# EasyEDA Pro project 尾部RGB灯板.epro

# Schematic Schematic1
Board Name: Board1; Create Date: 2025-04-24; Page Name: P1; Project Name: WS2812B灯带; Schematic Name: Schematic1; Update Date: 2025-04-24; BladeWidth: 10; Company: 嘉立创EDA; Page Size: A4; RegionStart: 1; ShowBorder: 1; TitleBlock: 1; TitleBlockPosition: 3; Version: V1.0; XRegionCount: 6; YRegionCount: 4
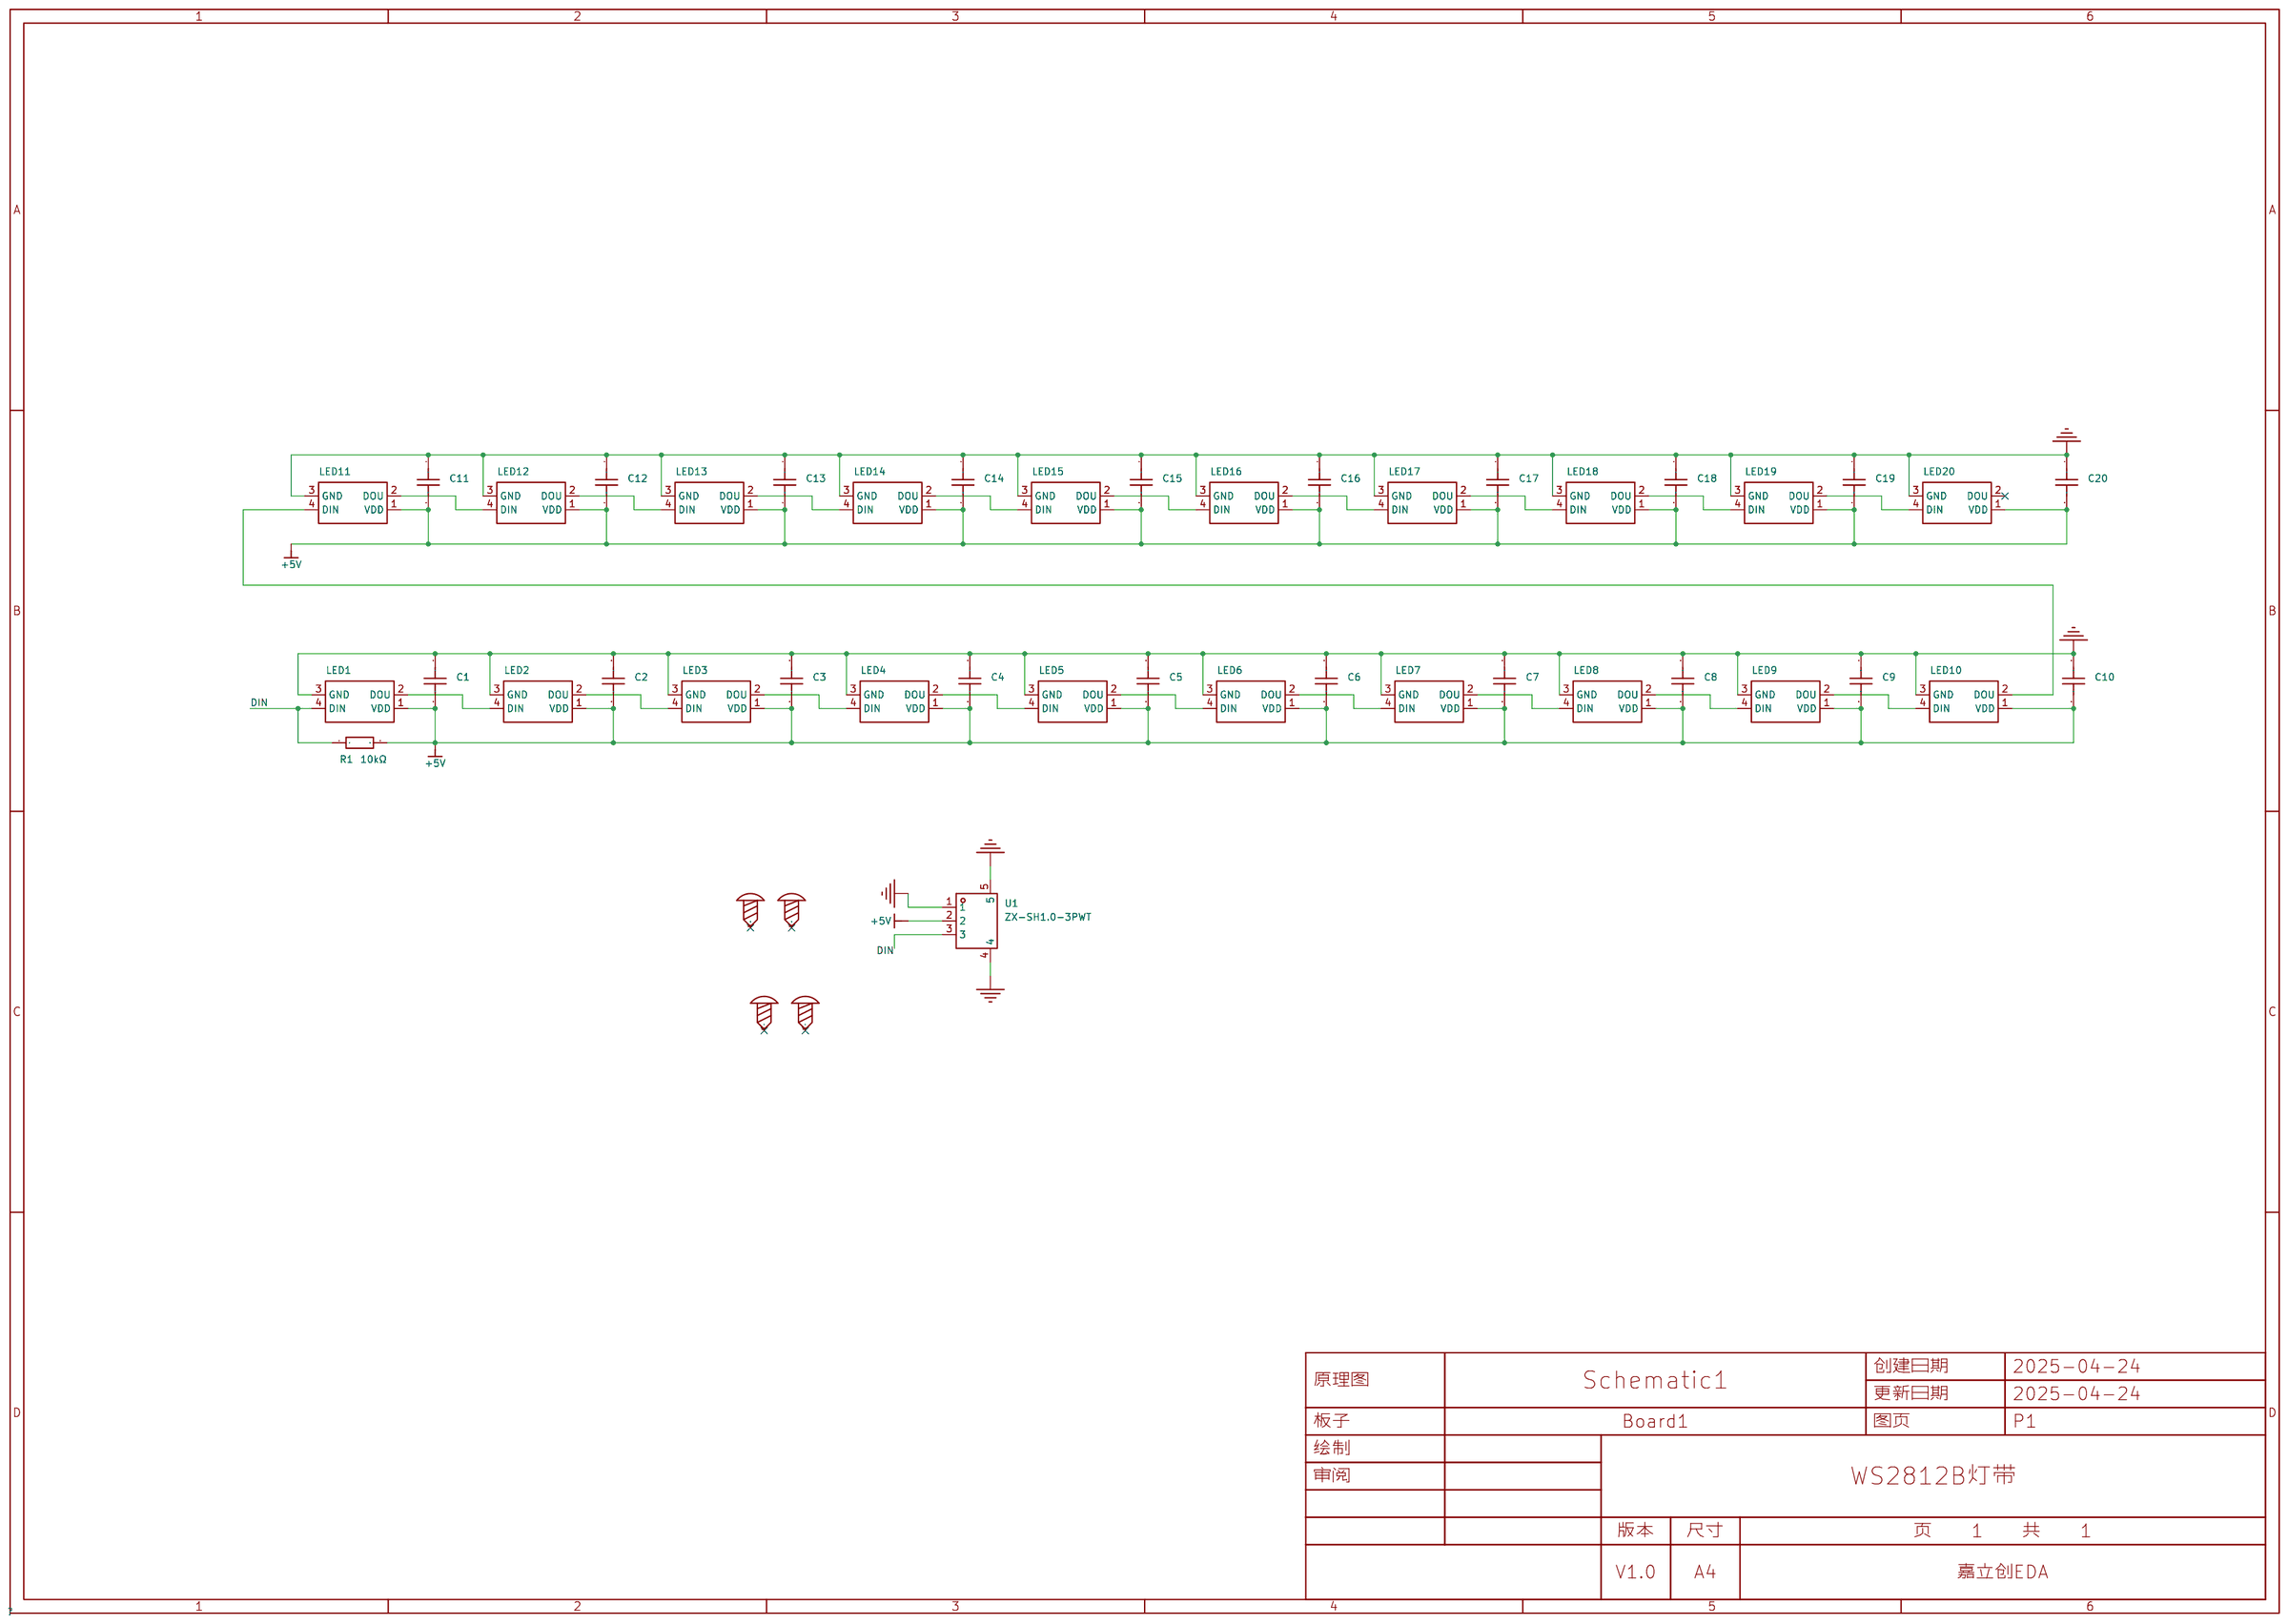
[diagram p0: schematic sheet]

## Parts
C1  100nF  [C0805]
C2  100nF  [C0805]
C3  100nF  [C0805]
C4  100nF  [C0805]
C5  100nF  [C0805]
C6  100nF  [C0805]
C7  100nF  [C0805]
C8  100nF  [C0805]
C9  100nF  [C0805]
C10  100nF  [C0805]
C11  100nF  [C0805]
C12  100nF  [C0805]
C13  100nF  [C0805]
C14  100nF  [C0805]
C15  100nF  [C0805]
C16  100nF  [C0805]
C17  100nF  [C0805]
C18  100nF  [C0805]
C19  100nF  [C0805]
C20  100nF  [C0805]
LED1  XL-5050RGBC-WS2812B  [LED-SMD_4P-L5.0-W5.0-BL_XL-5050RGBC]
LED2  XL-5050RGBC-WS2812B  [LED-SMD_4P-L5.0-W5.0-BL_XL-5050RGBC]
LED3  XL-5050RGBC-WS2812B  [LED-SMD_4P-L5.0-W5.0-BL_XL-5050RGBC]
LED4  XL-5050RGBC-WS2812B  [LED-SMD_4P-L5.0-W5.0-BL_XL-5050RGBC]
LED5  XL-5050RGBC-WS2812B  [LED-SMD_4P-L5.0-W5.0-BL_XL-5050RGBC]
LED6  XL-5050RGBC-WS2812B  [LED-SMD_4P-L5.0-W5.0-BL_XL-5050RGBC]
LED7  XL-5050RGBC-WS2812B  [LED-SMD_4P-L5.0-W5.0-BL_XL-5050RGBC]
LED8  XL-5050RGBC-WS2812B  [LED-SMD_4P-L5.0-W5.0-BL_XL-5050RGBC]
LED9  XL-5050RGBC-WS2812B  [LED-SMD_4P-L5.0-W5.0-BL_XL-5050RGBC]
LED10  XL-5050RGBC-WS2812B  [LED-SMD_4P-L5.0-W5.0-BL_XL-5050RGBC]
LED11  XL-5050RGBC-WS2812B  [LED-SMD_4P-L5.0-W5.0-BL_XL-5050RGBC]
LED12  XL-5050RGBC-WS2812B  [LED-SMD_4P-L5.0-W5.0-BL_XL-5050RGBC]
LED13  XL-5050RGBC-WS2812B  [LED-SMD_4P-L5.0-W5.0-BL_XL-5050RGBC]
LED14  XL-5050RGBC-WS2812B  [LED-SMD_4P-L5.0-W5.0-BL_XL-5050RGBC]
LED15  XL-5050RGBC-WS2812B  [LED-SMD_4P-L5.0-W5.0-BL_XL-5050RGBC]
LED16  XL-5050RGBC-WS2812B  [LED-SMD_4P-L5.0-W5.0-BL_XL-5050RGBC]
LED17  XL-5050RGBC-WS2812B  [LED-SMD_4P-L5.0-W5.0-BL_XL-5050RGBC]
LED18  XL-5050RGBC-WS2812B  [LED-SMD_4P-L5.0-W5.0-BL_XL-5050RGBC]
LED19  XL-5050RGBC-WS2812B  [LED-SMD_4P-L5.0-W5.0-BL_XL-5050RGBC]
LED20  XL-5050RGBC-WS2812B  [LED-SMD_4P-L5.0-W5.0-BL_XL-5050RGBC]
R1  10kΩ  [R0805]
SCREW1  -  [M3螺丝]
SCREW2  -  [M3螺丝]
SCREW3  -  [M3螺丝]
SCREW4  -  [M3螺丝]
U1  ZX-SH1.0-3PWT  [CONN-SMD_3P-P1.00_MEGASTAR_ZX-SH1.0-3PWT]

## Library data of the parts
C1-C20 = CC0805KRX7R9BB104: 容值:100nF;精度:±10%;额定电压:50V;材质(温度系数):X7R;; LCSC Part Name: 100nF ±10% 50V; Supplier Part: C49678; Manufacturer: YAGEO(国巨); Supplier Footprint: 0805; JLCPCB Part Class: 基础库; Datasheet: https://atta.szlcsc.com/upload/public/pdf/source/20180224/C181747_15194369449651363981.pdf; Supplier: LCSC; Tolerance: ±10%; Voltage Rated: 50V; Temperature Coefficient: X7R
LED1-LED20 = XL-5050RGBC-WS2812B: 5050七彩幻彩透明贴片LED灯珠 5050 幻彩透明四脚 ws2812B 内置驱动IC; Supplier Part: C2843785; Manufacturer: XINGLIGHT(成兴光); Supplier Footprint: SMD5050; JLCPCB Part Class: 扩展库; Datasheet: https://atta.szlcsc.com/upload/public/pdf/source/20240412/E1004CAA80592E31D08BFE019083806F.pdf; Supplier: LCSC
R1 = 0805W8F1002T5E_C17414: 电阻类型:厚膜电阻;阻值:10kΩ;精度:±1%;功率:125mW;最大工作电压:150V;温度系数:±100ppm/℃;; LCSC Part Name: 10kΩ ±1% 125mW 厚膜电阻; Supplier Part: C17414; Manufacturer: UNI-ROYAL(厚声); Manufacturer Part: 0805W8F1002T5E; Supplier Footprint: 0805; JLCPCB Part Class: 基础库; Datasheet: https://atta.szlcsc.com/upload/public/pdf/source/20200306/C422600_1E6D84923E4A46A82E41ADD87F860B5C.pdf; Supplier: LCSC; Type: 厚膜电阻; Tolerance: ±1%; Power(Watts): 125mW; Overload Voltage (Max): 150V; Temperature Coefficient: ±100ppm/℃; Operating Temperature Range: -55℃~+155℃
SCREW1-SCREW4 = M3螺丝: Supplier Footprint: 插件
U1 = ZX-SH1.0-3PWT: 插针结构:1x3P;间距:1mm;安装方式:卧贴;参考系列:SH;总PIN数:3P;排数:1;每排PIN数:3;行距:-;额定电流:1A;触头材质:黄铜;触头镀层:锡;工作温度:-40℃~+85℃;; LCSC Part Name: 1x3P 间距:1mm 卧贴 系列:SH; Supplier Part: C7430445; Manufacturer: Megastar(兆星); Supplier Footprint: SMD,P=1mm,卧贴; JLCPCB Part Class: Extended Part; Datasheet: https://item.szlcsc.com/datasheet/ZX-SH1.0-3PWT/8430314.html; Supplier: LCSC; Pins Structure: 1x3P; Pitch: 1mm; Mounting Type: 卧贴; Reference Series: SH; Number of Pins: 3P; Number of Rows: 1; Number of PINs Per Row: 3; Current Rating: 1A; Contact Material: 黄铜; Contact Plating: 锡; Operating Temperature: -40℃~+85℃; Voltage Rating: 50V; Plastic Material: LCP; Supplementary Features: 辅助焊脚; Color: 米色; Z-Height of the Board: 3.15mm; X-Length of Bottom Edge on Board (Spacing Line): 5.35mm; Y-Width of Bottom Edge on Board: 4.3mm

## Nets
+5V: C1.2 C2.2 C3.2 C4.2 C5.2 C6.2 C7.2 C8.2 C9.2 C10.2 C11.2 C12.2 C13.2 C14.2 C15.2 C16.2 C17.2 C18.2 C19.2 C20.2 LED1.1(VDD) LED2.1(VDD) LED3.1(VDD) LED4.1(VDD) LED5.1(VDD) LED6.1(VDD) LED7.1(VDD) LED8.1(VDD) LED9.1(VDD) LED10.1(VDD) LED11.1(VDD) LED12.1(VDD) LED13.1(VDD) LED14.1(VDD) LED15.1(VDD) LED16.1(VDD) LED17.1(VDD) LED18.1(VDD) LED19.1(VDD) LED20.1(VDD) R1.2 U1.2
GND: C1.1 C2.1 C3.1 C4.1 C5.1 C6.1 C7.1 C8.1 C9.1 C10.1 C11.1 C12.1 C13.1 C14.1 C15.1 C16.1 C17.1 C18.1 C19.1 C20.1 LED1.3(GND) LED2.3(GND) LED3.3(GND) LED4.3(GND) LED5.3(GND) LED6.3(GND) LED7.3(GND) LED8.3(GND) LED9.3(GND) LED10.3(GND) LED11.3(GND) LED12.3(GND) LED13.3(GND) LED14.3(GND) LED15.3(GND) LED16.3(GND) LED17.3(GND) LED18.3(GND) LED19.3(GND) LED20.3(GND) U1.1 U1.4 U1.5
DIN: LED1.4(DIN) R1.1 U1.3
$1N1120: LED9.2(DOU) LED10.4(DIN)
$1N1128: LED8.2(DOU) LED9.4(DIN)
$1N1132: LED7.2(DOU) LED8.4(DIN)
$1N1136: LED6.2(DOU) LED7.4(DIN)
$1N1142: LED5.2(DOU) LED6.4(DIN)
$1N1146: LED4.2(DOU) LED5.4(DIN)
$1N1150: LED3.2(DOU) LED4.4(DIN)
$1N1154: LED2.2(DOU) LED3.4(DIN)
$1N1158: LED1.2(DOU) LED2.4(DIN)
$1N3672: LED10.2(DOU) LED11.4(DIN)
$1N3842: LED11.2(DOU) LED12.4(DIN)
$1N3843: LED12.2(DOU) LED13.4(DIN)
$1N3844: LED13.2(DOU) LED14.4(DIN)
$1N3845: LED14.2(DOU) LED15.4(DIN)
$1N3846: LED15.2(DOU) LED16.4(DIN)
$1N3847: LED16.2(DOU) LED17.4(DIN)
$1N3848: LED17.2(DOU) LED18.4(DIN)
$1N3849: LED18.2(DOU) LED19.4(DIN)
$1N3850: LED19.2(DOU) LED20.4(DIN)

Not connected (* = marked no-connect by the designer): LED20 2(DOU)*; SCREW1 1*; SCREW2 1*; SCREW3 1*; SCREW4 1*

# Board PCB1
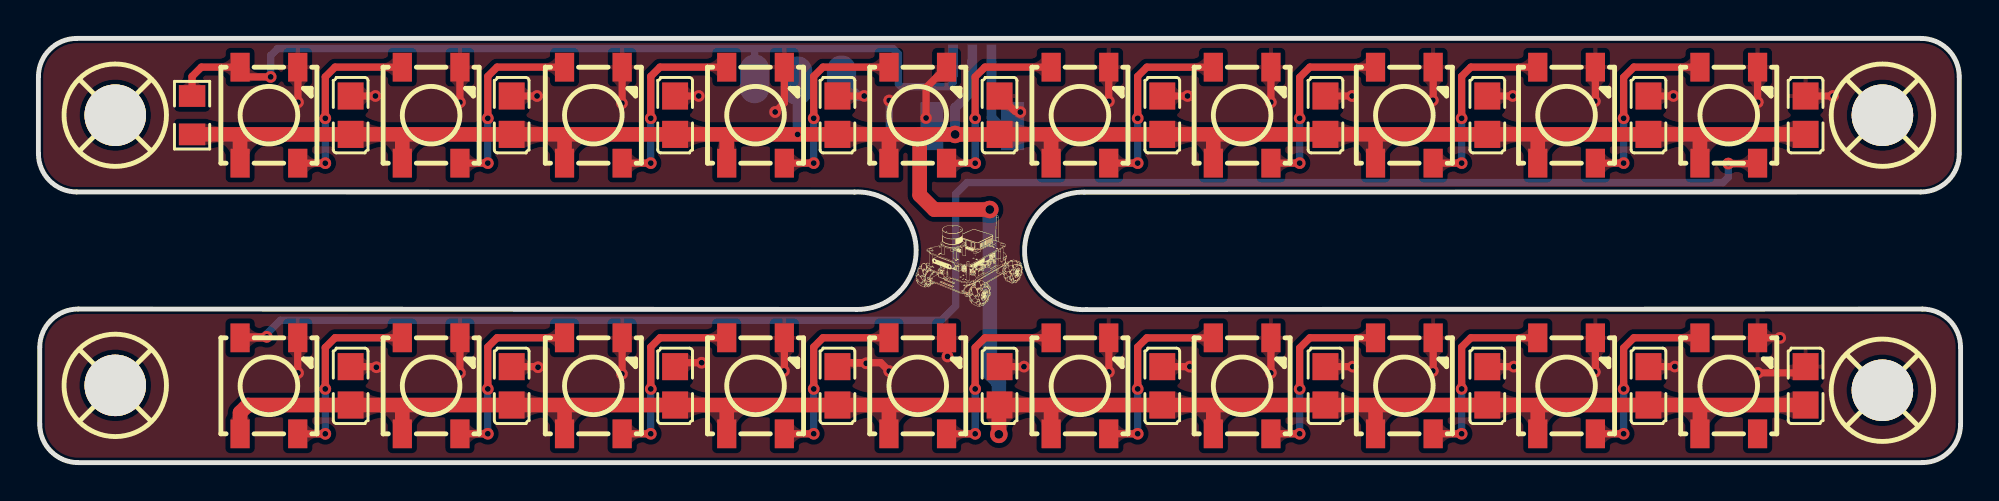
[diagram p1: board, top side]
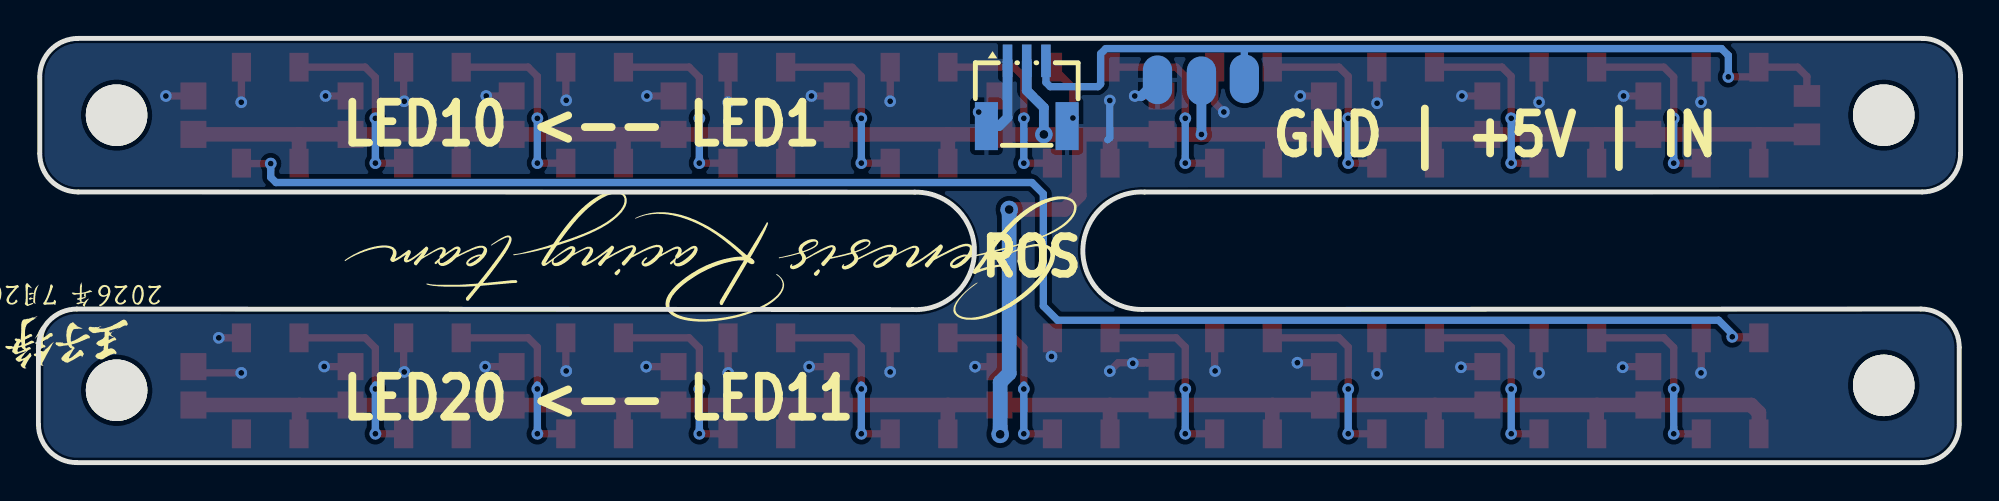
[diagram p2: board, bottom side, seen from below]

Outline 100.07 x 22.1 mm; copper layers: Top Layer, Bottom Layer. Coordinates in mm from the lower left corner of the outline.
Outline path: 0,20.1 arc(0.59,21.51) 2,22.1 98,22.1 arc(99.41,21.51) 100,20.1 100,16.1 arc(99.41,14.68) 98,14.1 54.45,14.09 arc(51.34,10.98) 54.55,7.97 98.07,8 arc(99.48,7.41) 100.07,6 100.07,2 arc(99.48,0.59) 98.07,0 2.07,0 arc(0.65,0.59) 0.07,2 0.07,6 arc(0.65,7.41) 2.07,8 42.59,7.98 arc(45.7,11.09) 42.48,14.09 2,14.1 arc(0.59,14.68) 0,16.1 0,20.1
Stack: Top Layer 0.035mm / Dielectric1 1.51mm FR4 er 4.5 / Bottom Layer 0.035mm

## Design rules (mm)
spacing copperThickness1oz (default): track to track 0.102, other pairs 0.152 to 0.3
spacing copperThickness2oz: track to track 0.203, other pairs 0.152 to 0.3
spacing Plane_innerPlane: track to track 0.102, other pairs 0.152 to 0.3
spacing Copper_copperRegion: track to track 0.102, other pairs 0.152 to 0.3
track width copperThickness1oz (default): min 0.127, default 0.254, max 2.54
track width copperThickness2oz: min 0.203, default 0.254, max 2.54
differential pair differentialPair (default): width min 0.127, default 0.254, max 2.54; gap min 0.152, default 0.152
net GND uses copperRegion_copperThickness1oz
pour e126 uses Copper_copperRegion, copperRegion_Copper_copperRegion
pour e181 uses Copper_copperRegion, copperRegion_Copper_copperRegion
pour e642 uses Copper_copperRegion, copperRegion_Copper_copperRegion
pour e657 uses Copper_copperRegion, copperRegion_Copper_copperRegion

## Placement (name value [footprint] x y rotation side)
C1  100nF  [C0805]  16.25 18.1 270 top
C2  100nF  [C0805]  24.64 18.1 270 top
C3  100nF  [C0805]  33.15 18.1 270 top
C4  100nF  [C0805]  41.6 18.1 270 top
C5  100nF  [C0805]  50.04 18.1 270 top
C6  100nF  [C0805]  58.51 18.1 270 top
C7  100nF  [C0805]  67 18.1 270 top
C8  100nF  [C0805]  75.43 18.1 270 top
C9  100nF  [C0805]  83.82 18.1 270 top
C10  100nF  [C0805]  92 18.1 270 top
C11  100nF  [C0805]  58.51 4 270 top
C12  100nF  [C0805]  50.04 4 270 top
C13  100nF  [C0805]  41.6 4 270 top
C14  100nF  [C0805]  33.15 4 270 top
C15  100nF  [C0805]  24.64 4 270 top
C16  100nF  [C0805]  16.25 4 270 top
C17  100nF  [C0805]  83.82 4 270 top
C18  100nF  [C0805]  75.43 4 270 top
C19  100nF  [C0805]  67 4 270 top
C20  100nF  [C0805]  92 4 270 top
LED1  XL-5050RGBC-WS2812B  [LED-SMD_4P-L5.0-W5.0-BL_XL-5050RGBC]  12 18.1 0 top
LED2  XL-5050RGBC-WS2812B  [LED-SMD_4P-L5.0-W5.0-BL_XL-5050RGBC]  20.44 18.1 0 top
LED3  XL-5050RGBC-WS2812B  [LED-SMD_4P-L5.0-W5.0-BL_XL-5050RGBC]  28.89 18.1 0 top
LED4  XL-5050RGBC-WS2812B  [LED-SMD_4P-L5.0-W5.0-BL_XL-5050RGBC]  37.33 18.1 0 top
LED5  XL-5050RGBC-WS2812B  [LED-SMD_4P-L5.0-W5.0-BL_XL-5050RGBC]  45.78 18.1 0 top
LED6  XL-5050RGBC-WS2812B  [LED-SMD_4P-L5.0-W5.0-BL_XL-5050RGBC]  54.22 18.1 0 top
LED7  XL-5050RGBC-WS2812B  [LED-SMD_4P-L5.0-W5.0-BL_XL-5050RGBC]  62.67 18.1 0 top
LED8  XL-5050RGBC-WS2812B  [LED-SMD_4P-L5.0-W5.0-BL_XL-5050RGBC]  71.11 18.1 0 top
LED9  XL-5050RGBC-WS2812B  [LED-SMD_4P-L5.0-W5.0-BL_XL-5050RGBC]  79.56 18.1 0 top
LED10  XL-5050RGBC-WS2812B  [LED-SMD_4P-L5.0-W5.0-BL_XL-5050RGBC]  88 18.1 0 top
LED11  XL-5050RGBC-WS2812B  [LED-SMD_4P-L5.0-W5.0-BL_XL-5050RGBC]  12 4 0 top
LED12  XL-5050RGBC-WS2812B  [LED-SMD_4P-L5.0-W5.0-BL_XL-5050RGBC]  20.44 4 0 top
LED13  XL-5050RGBC-WS2812B  [LED-SMD_4P-L5.0-W5.0-BL_XL-5050RGBC]  28.89 4 0 top
LED14  XL-5050RGBC-WS2812B  [LED-SMD_4P-L5.0-W5.0-BL_XL-5050RGBC]  37.33 4 0 top
LED15  XL-5050RGBC-WS2812B  [LED-SMD_4P-L5.0-W5.0-BL_XL-5050RGBC]  45.78 4 0 top
LED16  XL-5050RGBC-WS2812B  [LED-SMD_4P-L5.0-W5.0-BL_XL-5050RGBC]  54.22 4 0 top
LED17  XL-5050RGBC-WS2812B  [LED-SMD_4P-L5.0-W5.0-BL_XL-5050RGBC]  62.67 4 0 top
LED18  XL-5050RGBC-WS2812B  [LED-SMD_4P-L5.0-W5.0-BL_XL-5050RGBC]  71.11 4 0 top
LED19  XL-5050RGBC-WS2812B  [LED-SMD_4P-L5.0-W5.0-BL_XL-5050RGBC]  79.56 4 0 top
LED20  XL-5050RGBC-WS2812B  [LED-SMD_4P-L5.0-W5.0-BL_XL-5050RGBC]  88 4 0 top
NOREF  -  [Pad_e808]  39.52 19.89 0 top
NOREF#2  -  [Pad_e807]  37.29 19.99 0 top
NOREF#3  -  [Pad_e809]  41.81 19.94 0 top
R1  10kΩ  [R0805]  8 18.1 270 top
SCREW1  -  [M3螺丝]  96 18.1 0 top
SCREW2  -  [M3螺丝]  4 18.1 0 top
SCREW3  -  [M3螺丝]  4 4.02 0 top
SCREW4  -  [M3螺丝]  96 3.77 0 top
U1  ZX-SH1.0-3PWT  [CONN-SMD_3P-P1.00_MEGASTAR_ZX-SH1.0-3PWT]  48.62 19.23 180 bottom

## Footprints (pads in the part's own frame, mm; a bottom-side part is the same pattern mirrored in y, then rotated)
C0805
  rect 1.41x1.35 smd: 1(-1,0) 2(1,0)
CONN-SMD_3P-P1.00_MEGASTAR_ZX-SH1.0-3PWT
  rect 0.5x1.7 smd: 1(-1,1.7) 2(0,1.7) 3(1,1.7)
  rect 1.2x2.5 smd: 4(-2.1,-1.7) 5(2.1,-1.7)
LED-SMD_4P-L5.0-W5.0-BL_XL-5050RGBC
  rect 1x1.5 smd: 1(-1.5,-2.5) 2(1.5,-2.5) 3(1.5,2.5) 4(-1.5,2.5)
M3螺丝
  round 3.2 hole 3.2: 1(0,0)
Pad_e807
  oval 1.524x2.54 smd far side: 1(0,0)
Pad_e808
  oval 1.524x2.54 smd far side: 2(0,0)
Pad_e809
  oval 1.524x2.54 smd far side: 3(0,0)
R0805
  rect 1.133x1.377 smd: 1(-1,0) 2(1,0)

## Nets
As in the schematic, except:
+5V: C1.2 C2.2 C3.2 C4.2 C5.2 C6.2 C7.2 C8.2 C9.2 C10.2 C11.2 C12.2 C13.2 C14.2 C15.2 C16.2 C17.2 C18.2 C19.2 C20.2 LED1.1 LED2.1 LED3.1 LED4.1 LED5.1 LED6.1 LED7.1 LED8.1 LED9.1 LED10.1 LED11.1 LED12.1 LED13.1 LED14.1 LED15.1 LED16.1 LED17.1 LED18.1 LED19.1 LED20.1 NOREF.2 R1.2 U1.2
GND: C1.1 C2.1 C3.1 C4.1 C5.1 C6.1 C7.1 C8.1 C9.1 C10.1 C11.1 C12.1 C13.1 C14.1 C15.1 C16.1 C17.1 C18.1 C19.1 C20.1 LED1.3 LED2.3 LED3.3 LED4.3 LED5.3 LED6.3 LED7.3 LED8.3 LED9.3 LED10.3 LED11.3 LED12.3 LED13.3 LED14.3 LED15.3 LED16.3 LED17.3 LED18.3 LED19.3 LED20.3 NOREF#3.3 U1.1 U1.4 U1.5
DIN: LED1.4 NOREF#2.1 R1.1 U1.3

Pads without a net: LED20 2; SCREW1 1; SCREW2 1; SCREW3 1; SCREW4 1

## Via types
v1: diameter 0.61, hole 0.305, Top Layer to Bottom Layer, 82 vias
v2: diameter 0.914, hole 0.457, Top Layer to Bottom Layer, 3 vias

## Routing (per net, layer and track width the routed paths; a pad name or vN(x,y) marks a point on that pad's centre or on a via; arc(x,y) is an arc through that point)
+5V: length 222.9
  Top Layer w0.762: 69.58,17.1 69.61,17.07 LED8.1 ; 69.58,17.1 C7.2 61.19,17.1 ; 69.58,17.1 C8.2 78.04,17.1 ; 52.71,17.1 C6.2 61.19,17.1 ; 52.71,17.1 52.72,17.09 LED6.1 ; 52.71,17.1 C5.2 50.03,17.09 v2(47.72,17.09) 45.88,17.09 45.88,17.1 ; 86.48,3 C17.2 78.04,3 ; 86.48,3 86.5,2.98 LED20.1 ; 86.48,3 C20.2 ; 86.48,17.1 C10.2 ; 86.48,17.1 C9.2 78.04,17.1 ; 86.48,17.1 86.5,17.08 LED10.1 ; LED15.1 44.28,2.99 44.28,3 ; 44.28,17.1 C4.2 35.82,17.1 ; 44.28,17.1 45.88,17.1 ; 44.28,17.1 44.28,17.09 LED5.1 ; LED2.1 18.94,17.08 18.93,17.1 ; 78.04,17.1 78.06,17.09 LED9.1 ; 18.93,3 C15.2 27.37,3 ; 18.93,3 C16.2 10.9,3 10.5,2.6 LED11.1 ; 18.93,3 18.94,2.99 LED12.1 ; 18.93,17.1 C1.2 10.47,17.1 ; 18.93,17.1 C2.2 27.37,17.1 ; 61.17,15.6 61.17,17.07 61.19,17.1 ; v2(49.53,13.18) 46.63,13.18 45.88,13.94 45.88,17.1 ; 27.37,3 27.39,2.98 27.39,1.5 ; 27.37,3 C14.2 35.82,3 ; 61.19,3 61.17,2.97 61.17,1.5 ; 61.19,3 C19.2 69.58,3 ; 61.19,3 C11.2 52.71,3 ; 35.82,17.1 C3.2 27.37,17.1 ; 35.82,17.1 35.83,17.08 LED4.1 ; 52.71,3 C12.2 ; 52.71,3 52.72,2.99 LED16.1 ; C12.2 44.28,3 ; C12.2 50,2.96 v2(50,1.47) ; 69.58,3 69.61,2.97 LED18.1 ; 69.58,3 C18.2 78.04,3 ; 78.04,3 78.06,2.99 LED19.1 ; LED14.1 35.83,2.98 35.82,3 ; 35.82,3 C13.2 44.28,3 ; 27.37,17.1 27.39,17.08 27.39,15.6 ; 10.47,17.1 10.5,17.07 LED1.1 ; 10.47,17.1 R1.2
  Bottom Layer w0.508: v2(47.72,17.09) 47.72,18.49 48.62,19.38 48.62,20.88 ; NOREF.2 v1(39.52,17.09)
  Bottom Layer w0.762: v2(49.53,13.18) 49.53,4.65 50,4.18 v2(50,1.47)
GND: length 76.5
  Top Layer w0.381: LED2.3 21.94,18.77 ; LED18.3 72.61,4.79 v1(72.59,4.77) ; C9.1 v1(85.12,19.1) ; v1(13.51,18.77) 13.51,20.58 LED1.3 ; 41.6,5.2 42.33,5.2 ; 42.33,5.2 v1(43.09,5.17) ; 42.33,5.2 43.85,5.2 v1(44.29,4.77) ; LED10.3 89.5,18.78 v1(89.51,18.77) ; C8.1 v1(76.75,19.1) ; v1(55.73,4.72) 55.73,6.49 LED16.3 ; 38.83,6.7 38.83,4.8 v1(38.81,4.77) ; C16.1 17.56,5 v1(17.59,4.97) ; C20.1 91.67,4.67 v1(89.51,4.67) ; v1(46.21,17.95) 46.21,19.53 LED5.3 ; v1(81.03,4.72) 81.06,4.75 LED19.3 ; LED7.3 64.17,18.78 v1(64.16,18.77) ; v1(38.35,18.26) 38.83,18.74 38.83,20.6 ; LED3.3 30.39,18.73 v1(30.38,18.72) ; C19.1 v1(68.43,5) ; C7.1 v1(68.39,19.1) ; v1(72.59,18.87) 72.61,18.89 LED8.3 ; v1(30.38,4.62) 30.39,4.63 30.39,6.7 ; v1(47.33,5.53) 47.33,6.65 47.28,6.7 ; v1(64.16,4.67) 64.17,4.68 LED17.3 ; C2.1 v1(25.96,19.1) ; 33.15,5.2 v1(34.53,5.2) ; C6.1 v1(59.82,19.1) ; C18.1 v1(76.81,5) ; C11.1 v1(59.94,5) ; v1(81.03,18.82) 81.06,18.85 LED9.3 ; C10.1 93.43,19.1 v1(93.43,19.1) ; C15.1 25.98,5 v1(26.01,4.97) ; C17.1 85.19,5 v1(85.19,5) ; v1(55.73,18.82) 55.72,18.83 LED6.3 ; 13.5,6.7 13.5,4.69 v1(13.51,4.67) ; C1.1 v1(17.54,19.1) ; LED20.3 v1(90.68,6.5) ; C5.1 50.84,18.29 ; C3.1 v1(34.37,19.1) ; C12.1 v1(51.31,5) ; C4.1 v1(42.99,19.1) ; 21.94,6.7 21.94,4.67
  Bottom Layer w0.381: v1(44.29,18.86) 44.29,16.93 44.4,16.82
  Bottom Layer w0.508: U1.1 49.62,17.97 50.06,17.53 U1.4 ; v1(46.21,17.95) 46.52,17.65 U1.5 ; v1(42.99,19.1) 42.65,19.1 NOREF#3.3
  vias: v1(21.95,18.77) v1(21.95,4.67) v1(51.12,18.26)
DIN: length 46.8
  Top Layer w0.381: R1.1 8,20.12 8.48,20.6 10.31,20.6 10.82,20.09 v1(12.09,20.09)
  Bottom Layer w0.381: NOREF#2.1 37.29,21.56 37.28,21.57 ; v1(12.09,20.09) 12.09,21.21 12.45,21.57 37.28,21.57 ; 47.62,20.88 47.62,19.8 47.4,19.58 44.91,19.58 44.77,19.72 44.77,21.3 44.5,21.57 37.28,21.57
$1N1120: length 10.2
  Top Layer w0.381: 81.04,15.6 v1(82.53,15.6) ; LED10.4 86.5,20.6 83.06,20.6 82.53,20.07 v1(82.53,17.94)
  Bottom Layer w0.381: v1(82.53,15.6) v1(82.53,17.94)
$1N1128: length 10.2
  Top Layer w0.381: 72.6,15.6 v1(74.09,15.6) ; LED9.4 78.05,20.6 74.57,20.6 74.09,20.12 v1(74.09,17.94)
  Bottom Layer w0.381: v1(74.09,15.6) v1(74.09,17.94)
$1N1132: length 10.1
  Top Layer w0.381: v1(65.66,17.94) 65.66,20.07 66.19,20.6 69.61,20.6 LED8.4 ; 64.17,15.6 v1(65.66,15.6)
  Bottom Layer w0.381: v1(65.66,15.6) v1(65.66,17.94)
$1N1136: length 10.1
  Top Layer w0.381: 61.17,20.6 57.71,20.6 57.23,20.12 v1(57.23,17.94) ; 55.74,15.6 v1(57.23,15.6)
  Bottom Layer w0.381: v1(57.23,15.6) v1(57.23,17.94)
$1N1142: length 10.2
  Top Layer w0.381: LED5.2 v1(48.77,15.6) ; v1(48.77,17.94) 48.77,20.09 49.28,20.6 52.72,20.6 LED6.4
  Bottom Layer w0.381: v1(48.77,15.6) v1(48.77,17.94)
$1N1146: length 10.1
  Top Layer w0.381: 38.87,15.6 v1(40.36,15.6) ; v1(40.36,17.94) 40.36,20.12 40.84,20.6 44.28,20.6 LED5.4
  Bottom Layer w0.381: v1(40.36,15.6) v1(40.36,17.94)
$1N1150: length 10.2
  Top Layer w0.381: 30.39,15.6 v1(31.88,15.6) ; LED4.4 35.83,20.6 32.36,20.6 31.88,20.12 v1(31.88,17.94)
  Bottom Layer w0.381: v1(31.88,15.6) v1(31.88,17.94)
$1N1154: length 10.2
  Top Layer w0.381: 21.91,15.6 v1(23.4,15.6) ; 27.39,20.6 27.39,20.6 23.88,20.6 23.4,20.12 v1(23.4,17.94)
  Bottom Layer w0.381: v1(23.4,15.6) v1(23.4,17.94)
$1N1158: length 10.2
  Top Layer w0.381: v1(14.94,17.94) 14.94,20.09 15.44,20.6 18.94,20.6 LED2.4 ; LED1.2 v1(14.94,15.6)
  Bottom Layer w0.381: v1(14.94,15.6) v1(14.94,17.94)
$1N3672: length 88.1
  Top Layer w0.381: LED10.2 89.48,15.58 v1(87.97,15.58) ; 11.89,6.5 LED11.4 10.55,6.55 v1(11.89,6.55)
  Bottom Layer w0.381: v1(11.89,6.55) 11.89,6.71 12.6,7.42 47.01,7.42 47.75,8.15 47.75,14 48.34,14.59 87.7,14.59 87.97,14.86 v1(87.97,15.58)
$1N3842: length 9.9
  Top Layer w0.381: LED12.4 18.94,6.5 15.44,6.5 14.94,5.99 v1(14.94,3.84) ; LED11.2 v1(14.94,1.5)
  Bottom Layer w0.381: v1(14.94,3.84) 14.94,1.7
$1N3843: length 10
  Top Layer w0.381: 27.39,6.5 27.39,6.5 23.88,6.5 23.4,6.02 v1(23.4,3.84) ; 21.91,1.5 v1(23.4,1.5)
  Bottom Layer w0.381: v1(23.4,3.84) 23.4,1.71
$1N3844: length 10
  Top Layer w0.381: v1(31.88,3.84) 31.88,6.02 32.36,6.5 35.83,6.5 LED14.4 ; 30.39,1.5 v1(31.88,1.5)
  Bottom Layer w0.381: v1(31.88,3.84) 31.88,1.71
$1N3845: length 9.9
  Top Layer w0.381: v1(40.36,3.84) 40.36,6.02 40.84,6.5 44.28,6.5 LED15.4 ; 38.87,1.5 v1(40.36,1.5)
  Bottom Layer w0.381: v1(40.36,3.84) 40.36,1.71
$1N3846: length 10.4
  Top Layer w0.381: LED16.4 52.72,6.5 49.28,6.5 48.77,5.99 v1(48.77,3.84) ; LED15.2 v1(48.77,1.5)
  Bottom Layer w0.381: 48.77,4.04 v1(48.77,1.5)
$1N3847: length 10.3
  Top Layer w0.381: v1(57.23,3.84) 57.23,6.02 57.71,6.5 61.17,6.5 ; 55.74,1.5 v1(57.23,1.5)
  Bottom Layer w0.381: 57.23,4.04 v1(57.23,1.5)
$1N3848: length 9.9
  Top Layer w0.381: v1(65.66,3.84) 65.66,5.97 66.19,6.5 69.61,6.5 LED18.4 ; 64.17,1.5 v1(65.66,1.5)
  Bottom Layer w0.381: v1(65.66,3.84) 65.66,1.71
$1N3849: length 10.4
  Top Layer w0.381: 72.6,1.5 v1(74.09,1.5) ; v1(74.09,3.84) 74.09,6.02 74.57,6.5 78.05,6.5 LED19.4
  Bottom Layer w0.381: 74.09,4.04 v1(74.09,1.5)
$1N3850: length 10.4
  Top Layer w0.381: 81.04,1.5 v1(82.53,1.5) ; LED20.4 86.5,6.5 83.06,6.5 82.53,5.97 v1(82.53,3.84)
  Bottom Layer w0.381: 82.53,4.04 v1(82.53,1.5)

## Copper pours and planes (outline as drawn; the poured copper is in the pictures)
GND on Top Layer: -1.22,23.23 101.39,23.23 101.39,12.77 -1.22,12.77
GND on Top Layer: -3.81,33.05 111.81,33.05 111.81,-6.93 -3.81,-6.93
GND on Bottom Layer: -10.36,37.16 110.39,37.16 110.39,-9.47 -10.36,-9.47
GND on Bottom Layer: -2.4,24.5 103.48,24.5 103.48,11.8 -2.4,11.8

Small or netless copper shapes (teardrops, artwork), in the pictures only: 225 on Top Layer, 42 on Bottom Layer

## Text on the board
Bottom Silkscreen Layer: ROS | GND | +5V | IN | LED10 <-- LED1 | LED20 <-- LED11
